# Altium schematic sheet MotorConnection.SchDoc
size A4; SheetNumber: 5; SheetTotal: 5
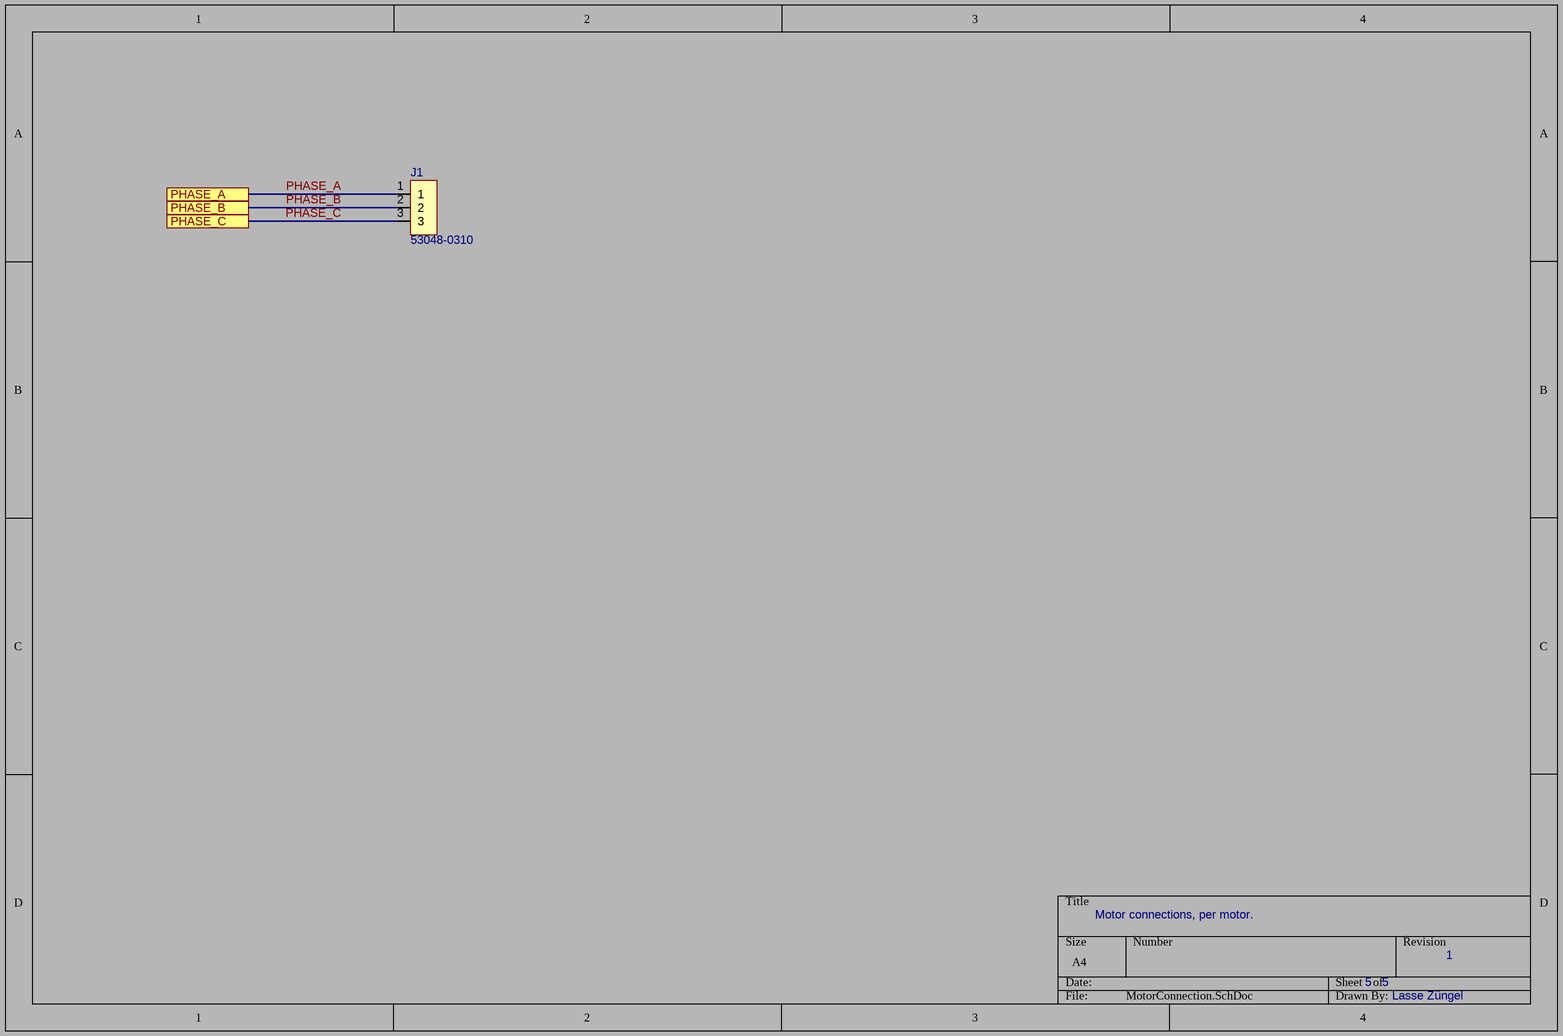
[diagram p0: MotorConnection.SchDoc]

## Parts
J1  53048-0310  [SHDRRA3W35P0X125_1X3_550X550X350P]

## Ports
PHASE_A (see Interfacing[4C], MotorDriverChannel[2C]), PHASE_B (see Interfacing[4D], MotorDriverChannel[2C]), PHASE_C (see Interfacing[4D], MotorDriverChannel[2C])

## Nets
PHASE_A: J1.1 ; port PHASE_A
PHASE_B: J1.2 ; port PHASE_B
PHASE_C: J1.3 ; port PHASE_C

## Notes on the sheet
- Motor connections, per motor.
- 5   5
- 1
- Lasse Züngel

## Library data of the parts
J1 = 53048-0310: Connector JST 1.25mm pitch THT; Manufacturer_Name: Molex; Datasheet Link: https://www.molex.com/pdm_docs/sd/530481010_sd.pdf; Height: 3.5mm; Manufacturer_Part_Number: 53048-0310; Mouser Part Number: 538-53048-0310; Mouser Price/Stock: https://www.mouser.co.uk/ProductDetail/Molex/53048-0310?qs=zXrbR4Jv0OfUlEeVnlaifA%3D%3D